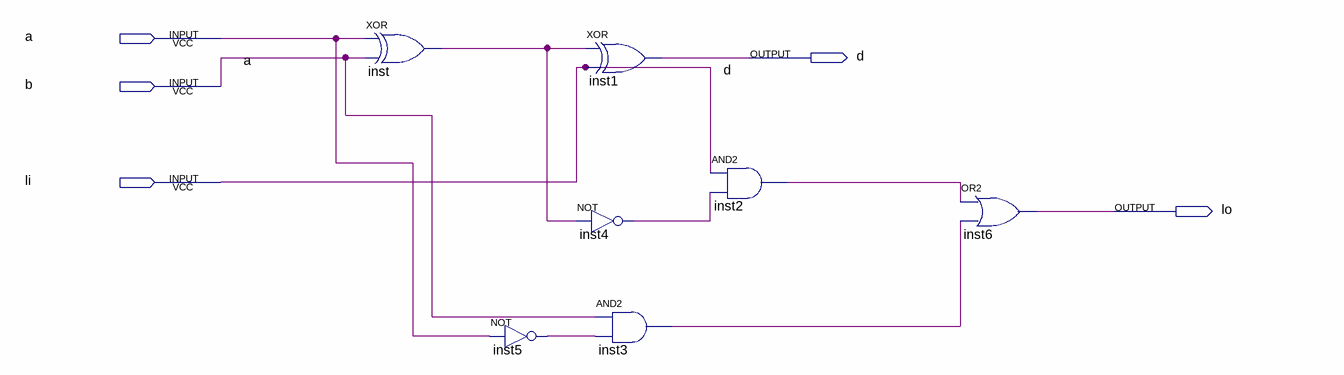
[diagram p0: schematic sheet]
// Quartus schematic fs.bdf as structural Verilog: 7 symbols, 5 pins
module fs (
  input  a,
  input  b,
  input  li,
  output d,
  output lo
);

  wire inst2_out, inst3_out, inst4_out, inst5_out, inst_out;

  xor inst (inst_out, a, b);
  not inst5 (inst5_out, a);
  xor inst1 (d, inst_out, li);
  not inst4 (inst4_out, inst_out);
  and inst3 (inst3_out, b, inst5_out);
  and inst2 (inst2_out, li, inst4_out);
  or inst6 (lo, inst2_out, inst3_out);
endmodule
